# Altium project Carrier-Board-v1.0.PrjPcb (part 6 of 9)

## Sheet DIGITAL_I-O_O-P.SchDoc
size A4; SheetNumber: 14; SheetTotal: 20
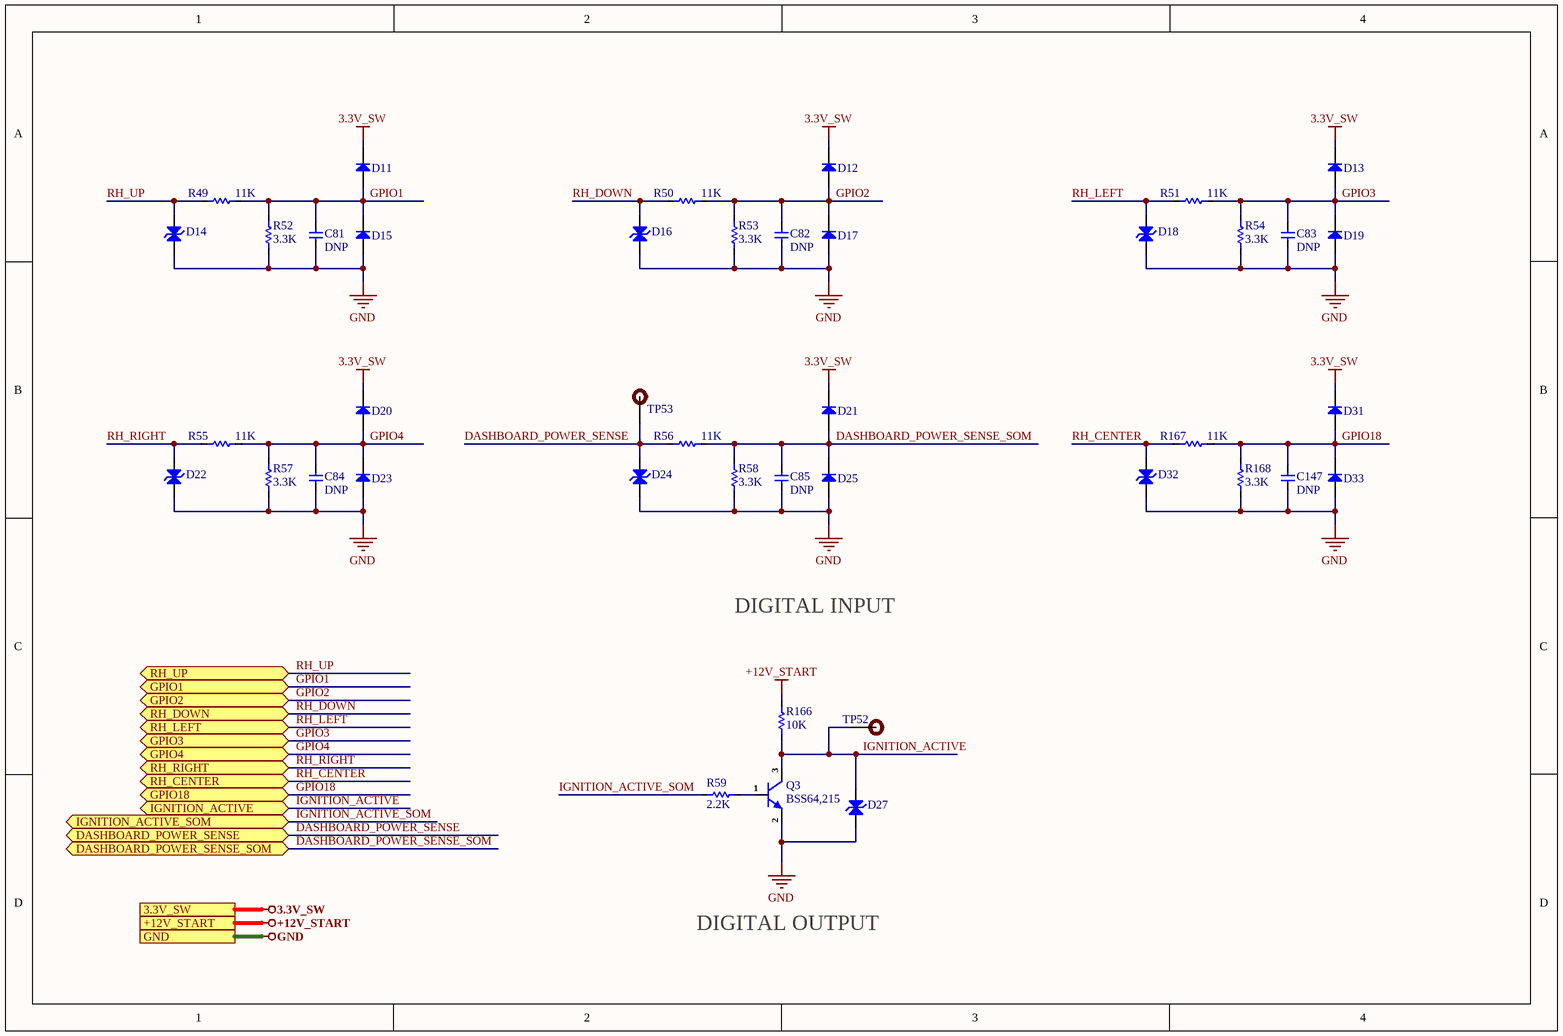
[diagram p13: DIGITAL_I-O_O-P.SchDoc]

### Parts
C81  DNP  [Cap-0603]
C82  DNP  [Cap-0603]
C83  DNP  [Cap-0603]
C84  DNP  [Cap-0603]
C85  DNP  [Cap-0603]
C147  DNP  [Cap-0603]
D11  BAS316,115  [SOD-323]  (value not drawn)
D12  BAS316,115  [SOD-323]  (value not drawn)
D13  BAS316,115  [SOD-323]  (value not drawn)
D14  SMAJ14CA-E3/61  [SMA]  (value not drawn)
D15  BAS316,115  [SOD-323]  (value not drawn)
D16  SMAJ14CA-E3/61  [SMA]  (value not drawn)
D17  BAS316,115  [SOD-323]  (value not drawn)
D18  SMAJ14CA-E3/61  [SMA]  (value not drawn)
D19  BAS316,115  [SOD-323]  (value not drawn)
D20  BAS316,115  [SOD-323]  (value not drawn)
D21  BAS316,115  [SOD-323]  (value not drawn)
D22  SMAJ14CA-E3/61  [SMA]  (value not drawn)
D23  BAS316,115  [SOD-323]  (value not drawn)
D24  SMAJ14CA-E3/61  [SMA]  (value not drawn)
D25  BAS316,115  [SOD-323]  (value not drawn)
D27  SMAJ14CA-E3/61  [SMA]  (value not drawn)
D31  BAS316,115  [SOD-323]  (value not drawn)
D32  SMAJ14CA-E3/61  [SMA]  (value not drawn)
D33  BAS316,115  [SOD-323]  (value not drawn)
Q3  BSS64,215  [SOT-23]
R49  11K  [Res-0603]
R50  11K  [Res-0603]
R51  11K  [Res-0603]
R52  3.3K  [Res-0603]
R53  3.3K  [Res-0603]
R54  3.3K  [Res-0603]
R55  11K  [Res-0603]
R56  11K  [Res-0603]
R57  3.3K  [Res-0603]
R58  3.3K  [Res-0603]
R59  2.2K  [Res-0603]
R166  10K  [Res-0603]
R167  11K  [Res-0603]
R168  3.3K  [Res-0603]
TP52  DNP  [Test-point]  (value not drawn)
TP53  DNP  [Test-point]  (value not drawn)

### Ports
3.3V_SW (see Top_Sheet[4B], ETHERNET_INTERFACE[1D], FUTURE_USE_CONNECTOR[1D], HDMI_INTERFACE[1D], I2C_INTERFACE[1B], MICRO_SD_CARD_INTERFACE[1D], UART_INTERFACE[1D]), +12V_START (see Top_Sheet[4A], CONNECTORS[1D], DC_DC_CONVERTER[1D], INPUT_SUPPLY_PROTECTION[1C]), DASHBOARD_POWER_SENSE (bidir, see Top_Sheet[3B], CONNECTORS[3D], GPIO_NC_INTERFACE[3D]), DASHBOARD_POWER_SENSE_SOM (bidir, see Top_Sheet[3B], GPIO_NC_INTERFACE[3D]), GND (see Top_Sheet[3A], 03-CAN2_SPI_CAN_CONTROLLER[1D], APALIS_POWER_SUPPLY[1D], CAN2_SPI_CAN_CONTROLLER[1D], CODEC_INTERFACE[1D], CONNECTORS[1D], DC_DC_CONVERTER[1D], ETHERNET_INTERFACE[1D], FUTURE_USE_CONNECTOR[1D], GPIO_NC_INTERFACE[4B], HDMI_INTERFACE[1D], I2C_INTERFACE[1B], INPUT_SUPPLY_PROTECTION[1D], LTE_MODULE[1D], MECHANICAL_FOR_PCB[1D], MICRO_SD_CARD_INTERFACE[1D], Reset_and_SDIO[1D], UART_INTERFACE[1D], USB3.0_INTERFACE[1D]), GPIO1 (bidir, see Top_Sheet[3B], FUTURE_USE_CONNECTOR[2C]), GPIO2 (bidir, see Top_Sheet[3B], FUTURE_USE_CONNECTOR[2C]), GPIO3 (bidir, see Top_Sheet[3B], FUTURE_USE_CONNECTOR[2C]), GPIO4 (bidir, see Top_Sheet[3B], FUTURE_USE_CONNECTOR[2C]), GPIO18 (bidir, see Top_Sheet[3B], GPIO_NC_INTERFACE[2A]), IGNITION_ACTIVE (bidir, see Top_Sheet[4B], CONNECTORS[4D]), IGNITION_ACTIVE_SOM (bidir, see Top_Sheet[4B], GPIO_NC_INTERFACE[1D]), RH_CENTER (bidir, see Top_Sheet[4B], CONNECTORS[4D]), RH_DOWN (bidir, see Top_Sheet[3B], CONNECTORS[4D]), RH_LEFT (bidir, see Top_Sheet[3B], CONNECTORS[4D]), RH_RIGHT (bidir, see Top_Sheet[3B], CONNECTORS[4D]), RH_UP (bidir, see Top_Sheet[3B], CONNECTORS[4D])

### Nets
3.3V_SW: D11.1(K) D12.1(K) D13.1(K) D20.1(K) D21.1(K) D31.1(K) ; port 3.3V_SW
+12V_START: R166.2 ; port +12V_START
GND: C81.1 C82.1 C83.1 C84.1 C85.1 C147.1 D14.1(A) D15.2(A) D16.1(A) D17.2(A) D18.1(A) D19.2(A) D22.1(A) D23.2(A) D24.1(A) D25.2(A) D27.1(A) D32.1(A) D33.2(A) Q3.2(E) R52.1 R53.1 R54.1 R57.1 R58.1 R168.1 ; port GND
DASHBOARD_POWER_SENSE: D24.2(A) R56.1 TP53.1 ; port DASHBOARD_POWER_SENSE
DASHBOARD_POWER_SENSE_SOM: C85.2 D21.2(A) D25.1(K) R56.2 R58.2 ; port DASHBOARD_POWER_SENSE_SOM
GPIO1: C81.2 D11.2(A) D15.1(K) R49.2 R52.2 ; port GPIO1
GPIO2: C82.2 D12.2(A) D17.1(K) R50.2 R53.2 ; port GPIO2
GPIO3: C83.2 D13.2(A) D19.1(K) R51.2 R54.2 ; port GPIO3
GPIO4: C84.2 D20.2(A) D23.1(K) R55.2 R57.2 ; port GPIO4
GPIO18: C147.2 D31.2(A) D33.1(K) R167.2 R168.2 ; port GPIO18
IGNITION_ACTIVE: D27.2(A) Q3.3(C) R166.1 TP52.1 ; port IGNITION_ACTIVE
IGNITION_ACTIVE_SOM: R59.1 ; port IGNITION_ACTIVE_SOM
RH_CENTER: D32.2(A) R167.1 ; port RH_CENTER
RH_DOWN: D16.2(A) R50.1 ; port RH_DOWN
RH_LEFT: D18.2(A) R51.1 ; port RH_LEFT
RH_RIGHT: D22.2(A) R55.1 ; port RH_RIGHT
RH_UP: D14.2(A) R49.1 ; port RH_UP
NetQ3_1: Q3.1(B) R59.2

### Notes on the sheet
- DIGITAL INPUT
- DIGITAL OUTPUT

### Library data of the parts
C81-C85 C147 = C1608NP01H101J080AA: as C78 on sheet I2C_INTERFACE; Supplier: Arrow Electronics; Supplier Part Number: C1608NP01H101J080AA; Manufacturer Part Number: C1608NP01H101J080AA; RoHS: Yes; Category: Ceramic Capacitors; Stock: 1236; Pricing: 1=0.1172, 10=0.0734, 25=0.0727, 50=0.0628, 100=0.0474, 250=0.0469, 500=0.0388, 1000=0.0313 (USD); ComponentLink1URL: http://www.mouser.com/ds/2/400/tdk_mlcc_commercial_general_en-542463.pdf?src-supplier=Mouser; ComponentLink1Description: http://www.mouser.com/ds/2/400/tdk_mlcc_commercial_general_en-542463.pdf?src-supplier=Mouser; ComponentLink2URL: https://datasheet.octopart.com/C1608NP01H101J080AA-TDK-datasheet-43914282.pdf?src-supplier=Future+Electronics; ComponentLink2Description: https://datasheet.octopart.com/C1608NP01H101J080AA-TDK-datasheet-43914282.pdf?src-supplier=Future+Electronics; ComponentLink3URL: https://product.tdk.com/info/en/catalog/datasheets/mlcc_commercial_hightemp_en.pdf?ref_disty=digikey&src-supplier=Digi-Key; ComponentLink3Description: https://product.tdk.com/info/en/catalog/datasheets/mlcc_commercial_hightemp_en.pdf?ref_disty=digikey&src-supplier=Digi-Key; ComponentLink4URL: https://product.tdk.com/info/en/documents/chara_sheet/C1608NP01H101J080AA.pdf?src-supplier=Digi-Key; ComponentLink4Description: https://product.tdk.com/info/en/documents/chara_sheet/C1608NP01H101J080AA.pdf?src-supplier=Digi-Key; ComponentLink5URL: http://product.tdk.com/en/catalog/datasheets/mlcc_commercial_hightemp_en.pdf?src-supplier=Avnet; ComponentLink5Description: http://product.tdk.com/en/catalog/datasheets/mlcc_commercial_hightemp_en.pdf?src-supplier=Avnet
D11-D13 D15 D17 D19-D21 D23 D25 D31 D33 = BAS316,115: as D5 on sheet I2C_INTERFACE; Supplier: Rs; Supplier Part Number: 1821844P; Manufacturer Part Number: BAS316,115; RoHS: Yes; Category: Rectifier Diodes; Stock: 258600; Pricing: 600=0.062, 1200=0.039, 1800=0.037, 2400=0.035 (GBP); Pins: 2NUMBER; Max Operating Temperature: 150°C; Max Repetitive Reverse Voltage (Vrrm): 100V; Packaging: 10Packaging; Reverse Voltage: 100V; Height: 1.1mm; RoHS Compliant: Yes; ComponentLink1URL: http://www.farnell.com/datasheets/1856332.pdf?src-supplier=Farnell; ComponentLink1Description: http://www.farnell.com/datasheets/1856332.pdf?src-supplier=Farnell; ComponentLink2URL: https://assets.nexperia.com/documents/data-sheet/BAS16_SER.pdf?src-supplier=Digi-Key; ComponentLink2Description: https://assets.nexperia.com/documents/data-sheet/BAS16_SER.pdf?src-supplier=Digi-Key; ComponentLink3URL: https://datasheet.octopart.com/BAS316%2C115-Nexperia-datasheet-77871323.pdf?src-supplier=Future+Electronics; ComponentLink3Description: https://datasheet.octopart.com/BAS316%2C115-Nexperia-datasheet-77871323.pdf?src-supplier=Future+Electronics; ComponentLink4URL: https://datasheet.octopart.com/BAS316%2C115-Nexperia-datasheet-32749520.pdf?src-supplier=Element14; ComponentLink4Description: https://datasheet.octopart.com/BAS316%2C115-Nexperia-datasheet-32749520.pdf?src-supplier=Element14; ComponentLink5URL: http://www.farnell.com/datasheets/1856332.pdf?src-supplier=Newark; ComponentLink5Description: http://www.farnell.com/datasheets/1856332.pdf?src-supplier=Newark; ComponentLink6URL: https://datasheet.octopart.com/BAS316%2C115-NXP-datasheet-5319124.pdf?src-supplier=TME; ComponentLink6Description: https://datasheet.octopart.com/BAS316%2C115-NXP-datasheet-5319124.pdf?src-supplier=TME
D14 D16 D18 D22 D24 D27 D32 = SMAJ14CA-E3/61: as D7 on sheet I2C_INTERFACE; Supplier: Mouser; Supplier Part Number: 625-SMAJ14CA-E3; Manufacturer Part Number: SMAJ14CA-E3/61; RoHS: Yes; Category: TVS Diodes; Stock: 15510; Pricing: 1=0.48, 10=0.36, 50=0.36, 100=0.221, 1000=0.127, 10000=0.099 (USD); ComponentLink1URL: https://datasheet.ciiva.com/4515/smaj50a-241759-4515304.pdf?src-supplier=Mouser; ComponentLink1Description: https://datasheet.ciiva.com/4515/smaj50a-241759-4515304.pdf?src-supplier=Mouser; ComponentLink2URL: https://datasheet.ciiva.com/16382/smaj50a-16382075.pdf?src-supplier=Future+Electronics; ComponentLink2Description: https://datasheet.ciiva.com/16382/smaj50a-16382075.pdf?src-supplier=Future+Electronics
Q3 = BSS64,215: TRANS NPN 80V 0.1A TO236AB; Manufacturer: Nexperia; Supplier: Future Electronics; Supplier Part Number: 6621338; Manufacturer Part Number: BSS64,215; RoHS: Yes; Category: BJTs; Stock: 3000; Pricing: 3000=0.0487, 9000=0.047, 15000=0.0462, 60000=0.044, 90000=0.0427 (USD); Packaging: 10Packaging; ComponentLink1URL: https://datasheet.octopart.com/BSS64%2C215-Nexperia-datasheet-87581098.pdf?src-supplier=TME; ComponentLink1Description: https://datasheet.octopart.com/BSS64%2C215-Nexperia-datasheet-87581098.pdf?src-supplier=TME
R49-R51 R55 R56 R167 = RT0603DRD0711KL: as R45 on sheet I2C_INTERFACE; Supplier: Future Electronics; Supplier Part Number: 3061514; Manufacturer Part Number: RT0603DRD0711KL; RoHS: Yes; Category: Chip SMD Resistors; Stock: 70000; Pricing: 5000=0.0133, 15000=0.0128, 25000=0.0126, 100000=0.012, 150000=0.0117 (USD); ComponentLink1URL: https://datasheet.ciiva.com/8891/pyu-rt-1-to-0-05-rohs-l-4-8891301.pdf?src-supplier=Avnet; ComponentLink1Description: https://datasheet.ciiva.com/8891/pyu-rt-1-to-0-05-rohs-l-4-8891301.pdf?src-supplier=Avnet
R52-R54 R57 R58 R168 = ERJ-U3RD3301V: as R47 on sheet I2C_INTERFACE; Supplier: Mouser; Supplier Part Number: 667-ERJ-U3RD3301V; Manufacturer Part Number: ERJ-U3RD3301V; RoHS: No; Category: Chip SMD Resistors; Stock: 19153; Pricing: 1=0.19, 10=0.105, 50=0.105, 100=0.047, 1000=0.029, 10000=0.023 (USD)
R59 = ERA-3AED222V: RES SMD 2.2K OHM 0.5% 1/10W 0603; Manufacturer: Panasonic; Value: 2.2kR; Power Rating: 100mW; Voltage Rating: 150V; Temperature Coefficient: 25ppm/°C; Supplier: Digi-Key; Supplier Part Number: P123753DKR-ND; Manufacturer Part Number: ERA-3AED222V; RoHS: Yes; Category: Chip SMD Resistors; Pricing: 1=0.27, 10=0.23, 25=0.1672, 50=0.1212, 100=0.0899, 250=0.069, 500=0.05436, 1000=0.03763 (USD); Mounting Technology: Surface Mount; Case/Package: 0603; Case Code (Imperial): 0603; Case Code (Metric): 1608; Contact Plating: Tin; Min Operating Temperature: -55°C; Max Operating Temperature: 155°C; Tolerance: 0.5%; Package Quantity: 5000; Packaging: Tape and Reel; Series: ERA-3A; Features: Automotive AEC-Q200; Max Power Dissipation: 100mW; Number of Terminations: 2; Length: 1.6mm; Width: 0.8mm; Height: 0.45mm; Ratings: AEC-Q200; Lead Free: Lead Free; RoHS Compliant: Yes; ComponentLink1URL: https://datasheet.ciiva.com/24024/aoa0000ce26-197354-24024457.pdf?src-supplier=Mouser; ComponentLink1Description: https://datasheet.ciiva.com/24024/aoa0000ce26-197354-24024457.pdf?src-supplier=Mouser
R166 = RCA060310K0FKEAHP: RES SMD 10K OHM 1% 1/10W 0603; Manufacturer: Vishay Dale; Value: 10kR; Max Power Dissipation: 250mW; Temperature Coefficient: 100ppm/°C; Supplier: Future Electronics; Supplier Part Number: 4171415; Manufacturer Part Number: RCA060310K0FKEAHP; RoHS: Yes; Category: Chip SMD Resistors; Stock: 10000; Pricing: 5000=0.0413, 10000=0.0403, 15000=0.0397, 25000=0.0389, 50000=0.0374 (USD); Case/Package: 0603; Case Code (Imperial): 0603; Case Code (Metric): 1608; Min Operating Temperature: -55°C; Max Operating Temperature: 155°C; Features: Automotive AEC-Q200,Anti-Sulfur; Packaging: Cut Tape; Tolerance: 1%; Number of Terminations: 2; Series: RCA-HP; Ratings: AEC-Q200; RoHS Compliant: Yes; ComponentLink1URL: http://www.vishay.com/docs/20067/rcahp.pdf?src-supplier=Digi-Key; ComponentLink1Description: http://www.vishay.com/docs/20067/rcahp.pdf?src-supplier=Digi-Key
TP52 TP53 = TEST POINT: Test Point ON; Item Type: TEST POINT

## Sheet CONNECTORS.SchDoc
size A4; SheetNumber: 15; SheetTotal: 20
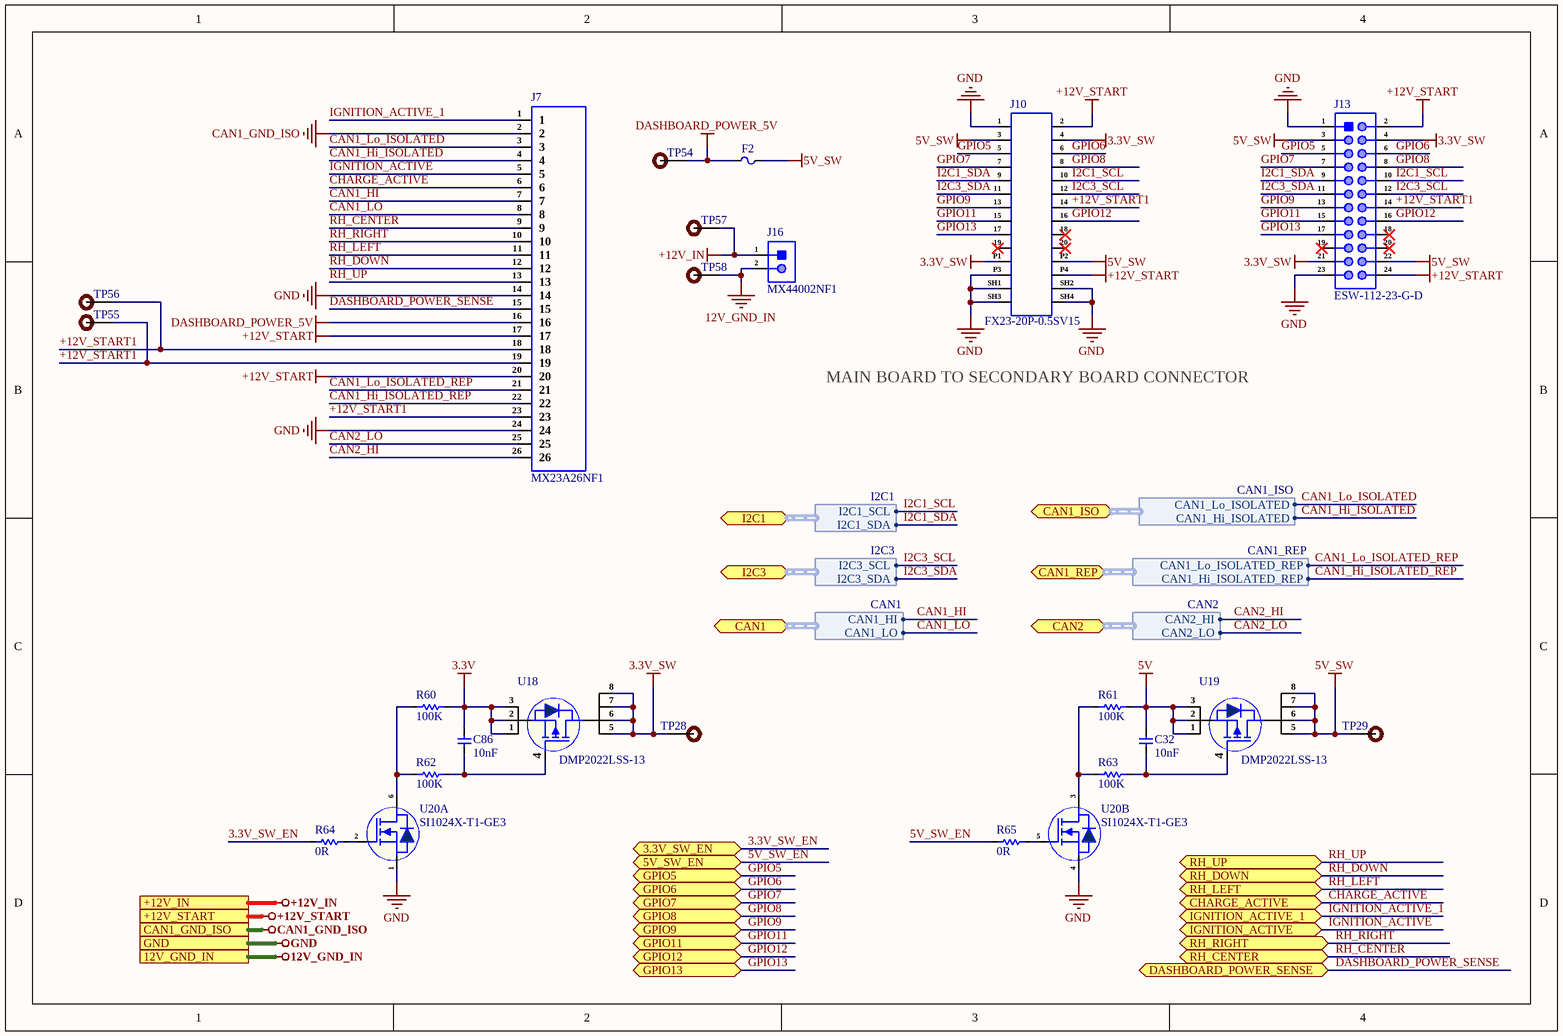
[diagram p14: CONNECTORS.SchDoc]

### Parts
C32  10nF  [Cap-0402]
C86  10nF  [Cap-0402]
F2  0458001.DR  [0458001.DR]  (value not drawn)
J7  MX23A26NF1  [MX23A26NF1]
J10  FX23-20P-0.5SV15  [FX23-20P-0.5SV15]
J13  ESW-112-23-G-D  [ESW-112-23-G-D]
J16  MX44002NF1  [MX44002NF1]
R60  100K  [Res-0402]
R61  100K  [Res-0402]
R62  100K  [Res-0402]
R63  100K  [Res-0402]
R64  0R  [Res-0402]
R65  0R  [Res-0402]
TP28  DNP  [Test-point]  (value not drawn)
TP29  DNP  [Test-point]  (value not drawn)
TP54  DNP  [Test-point]  (value not drawn)
TP55  DNP  [Test-point]  (value not drawn)
TP56  DNP  [Test-point]  (value not drawn)
TP57  DNP  [Test-point]  (value not drawn)
TP58  DNP  [Test-point]  (value not drawn)
U18  DMP2022LSS-13  [SOIC-8]
U19  DMP2022LSS-13  [SOIC-8]
U20  SI1024X-T1-GE3  [SC-89]  (parts A,B of 2)

### Ports
3.3V_SW_EN (bidir, see Top_Sheet[3D], I2C_INTERFACE[2B]), 5V_SW_EN (bidir, see Top_Sheet[3D], I2C_INTERFACE[2B]), 12V_GND_IN (see Top_Sheet[3C], INPUT_SUPPLY_PROTECTION[1D]), +12V_IN (see Top_Sheet[4C], INPUT_SUPPLY_PROTECTION[1C]), +12V_START (see Top_Sheet[4C], DC_DC_CONVERTER[1D], DIGITAL_I-O_O-P[1D], INPUT_SUPPLY_PROTECTION[1C]), CAN1 (bidir, harness CAN1, see Top_Sheet[4C], 03-CAN2_SPI_CAN_CONTROLLER[3D]), CAN1_GND_ISO (see Top_Sheet[3C], 03-CAN2_SPI_CAN_CONTROLLER[1D]), CAN1_ISO (bidir, harness CAN1_ISO, see Top_Sheet[4C], 03-CAN2_SPI_CAN_CONTROLLER[3C]), CAN1_REP (bidir, harness CAN1_REP, see Top_Sheet[4C], 03-CAN2_SPI_CAN_CONTROLLER[3D]), CAN2 (bidir, harness CAN2, see Top_Sheet[4D], CAN2_SPI_CAN_CONTROLLER[2D]), CHARGE_ACTIVE (bidir, see Top_Sheet[3D], I2C_INTERFACE[2B]), DASHBOARD_POWER_SENSE (bidir, see Top_Sheet[3D], DIGITAL_I-O_O-P[1D], GPIO_NC_INTERFACE[3D]), GND (see Top_Sheet[3C], 03-CAN2_SPI_CAN_CONTROLLER[1D], APALIS_POWER_SUPPLY[1D], CAN2_SPI_CAN_CONTROLLER[1D], CODEC_INTERFACE[1D], DC_DC_CONVERTER[1D], DIGITAL_I-O_O-P[1D], ETHERNET_INTERFACE[1D], FUTURE_USE_CONNECTOR[1D], GPIO_NC_INTERFACE[4B], HDMI_INTERFACE[1D], I2C_INTERFACE[1B], INPUT_SUPPLY_PROTECTION[1D], LTE_MODULE[1D], MECHANICAL_FOR_PCB[1D], MICRO_SD_CARD_INTERFACE[1D], Reset_and_SDIO[1D], UART_INTERFACE[1D], USB3.0_INTERFACE[1D]), GPIO5 (bidir, see Top_Sheet[3C], FUTURE_USE_CONNECTOR[2C]), GPIO6 (bidir, see Top_Sheet[3C], FUTURE_USE_CONNECTOR[2C]), GPIO7 (bidir, see Top_Sheet[3C], FUTURE_USE_CONNECTOR[2C]), GPIO8 (bidir, see Top_Sheet[3C], FUTURE_USE_CONNECTOR[2D]), GPIO9 (bidir, see Top_Sheet[3C], FUTURE_USE_CONNECTOR[3C], GPIO_NC_INTERFACE[1D]), GPIO11 (bidir, see Top_Sheet[3C], FUTURE_USE_CONNECTOR[3C], GPIO_NC_INTERFACE[3B]), GPIO12 (bidir, see Top_Sheet[3C], FUTURE_USE_CONNECTOR[3C], GPIO_NC_INTERFACE[3B]), GPIO13 (bidir, see Top_Sheet[3C], FUTURE_USE_CONNECTOR[3C], GPIO_NC_INTERFACE[3B]), I2C1 (bidir, harness I2C1, see Top_Sheet[3D], FUTURE_USE_CONNECTOR[2D], I2C_INTERFACE[4B]), I2C3 (bidir, harness I2C3, see Top_Sheet[3C], CODEC_INTERFACE[3D], I2C_INTERFACE[4B]), IGNITION_ACTIVE (bidir, see Top_Sheet[4D], DIGITAL_I-O_O-P[1D]), IGNITION_ACTIVE_1 (bidir, see Top_Sheet[3D], I2C_INTERFACE[2B]), RH_CENTER (bidir, see Top_Sheet[4C], DIGITAL_I-O_O-P[1D]), RH_DOWN (bidir, see Top_Sheet[4C], DIGITAL_I-O_O-P[1C]), RH_LEFT (bidir, see Top_Sheet[4C], DIGITAL_I-O_O-P[1C]), RH_RIGHT (bidir, see Top_Sheet[4C], DIGITAL_I-O_O-P[1C]), RH_UP (bidir, see Top_Sheet[4C], DIGITAL_I-O_O-P[1C])

### Harnesses
CAN1_ISO: CAN1_Lo_ISOLATED, CAN1_Hi_ISOLATED
CAN1_REP: CAN1_Lo_ISOLATED_REP, CAN1_Hi_ISOLATED_REP
CAN1: CAN1_HI, CAN1_LO
I2C1: I2C1_SCL, I2C1_SDA
I2C3: I2C3_SCL, I2C3_SDA
CAN2: CAN2_HI, CAN2_LO

### Nets
3.3V: C86.2 R60.2 U18.1(S) U18.2(S) U18.3(S)
3.3V_SW: J10.4 J10.P1 J13.4 J13.21 TP28.1 U18.5(D) U18.6(D) U18.7(D) U18.8(D)
5V: C32.2 R61.2 U19.1(S) U19.2(S) U19.3(S)
5V_SW: F2.2 J10.3 J10.P2 J13.3 J13.22 TP29.1 U19.5(D) U19.6(D) U19.7(D) U19.8(D)
12V_GND_IN: J16.2 TP58.1 ; port 12V_GND_IN
+12V_IN: J16.1 TP57.1 ; port +12V_IN
+12V_START: J7.17 J7.20 J10.2 J10.P4 J13.2 J13.24 ; port +12V_START
CAN1_GND_ISO: J7.2 ; port CAN1_GND_ISO
DASHBOARD_POWER_5V: F2.1 J7.16 TP54.1
GND: J7.14 J7.24 J10.1 J10.P3 J10.SH1 J10.SH2 J10.SH3 J10.SH4 J13.1 J13.23 U20.1(S1) U20.4(S2) ; port GND
3.3V_SW_EN: R64.1 ; port 3.3V_SW_EN
5V_SW_EN: R65.1 ; port 5V_SW_EN
+12V_START1: J7.18 J7.19 J7.23 J10.14 J13.14 TP55.1 TP56.1
CAN1_HI: J7.7 ; port CAN1.CAN1_HI  [project net CAN1.CAN1_HI]
CAN1_Hi_ISOLATED: J7.4 ; port CAN1_ISO.CAN1_Hi_ISOLATED
CAN1_Hi_ISOLATED_REP: J7.22 ; port CAN1_REP.CAN1_Hi_ISOLATED_REP
CAN1_LO: J7.8 ; port CAN1.CAN1_LO  [project net CAN1.CAN1_LO]
CAN1_Lo_ISOLATED: J7.3 ; port CAN1_ISO.CAN1_Lo_ISOLATED  [project net CAN1_ISO.CAN1_Lo_ISOLATED]
CAN1_Lo_ISOLATED_REP: J7.21 ; port CAN1_REP.CAN1_Lo_ISOLATED_REP
CAN2_HI: J7.26 ; port CAN2.CAN2_HI  [project net CAN2.CAN2_HI]
CAN2_LO: J7.25 ; port CAN2.CAN2_LO  [project net CAN2.CAN2_LO]
CHARGE_ACTIVE: J7.6 ; port CHARGE_ACTIVE
DASHBOARD_POWER_SENSE: J7.15 ; port DASHBOARD_POWER_SENSE
GPIO5: J10.5 J13.5 ; port GPIO5
GPIO6: J10.6 J13.6 ; port GPIO6
GPIO7: J10.7 J13.7 ; port GPIO7
GPIO8: J10.8 J13.8 ; port GPIO8
GPIO9: J10.13 J13.13 ; port GPIO9
GPIO11: J10.15 J13.15 ; port GPIO11
GPIO12: J10.16 J13.16 ; port GPIO12
GPIO13: J10.17 J13.17 ; port GPIO13
I2C1_SCL: J10.10 J13.10 ; port I2C1.I2C1_SCL  [project net I2C1.I2C1_SCL]
I2C1_SDA: J10.9 J13.9 ; port I2C1.I2C1_SDA  [project net I2C1.I2C1_SDA]
I2C3_SCL: J10.12 J13.12 ; port I2C3.I2C3_SCL  [project net I2C3.I2C3_SCL]
I2C3_SDA: J10.11 J13.11 ; port I2C3.I2C3_SDA  [project net I2C3.I2C3_SDA]
IGNITION_ACTIVE: J7.5 ; port IGNITION_ACTIVE
IGNITION_ACTIVE_1: J7.1 ; port IGNITION_ACTIVE_1
RH_CENTER: J7.9 ; port RH_CENTER
RH_DOWN: J7.12 ; port RH_DOWN
RH_LEFT: J7.11 ; port RH_LEFT
RH_RIGHT: J7.10 ; port RH_RIGHT
RH_UP: J7.13 ; port RH_UP
NetC32_1: C32.1 R63.2 U19.4(G)
NetC86_1: C86.1 R62.2 U18.4(G)
NetR60_1: R60.1 R62.1 U20.6(D1)
NetR61_1: R61.1 R63.1 U20.3(D2)
NetR64_2: R64.2 U20.2(G1)
NetR65_2: R65.2 U20.5(G2)

Not connected (* = marked no-connect by the designer): J10 18* 19* 20*; J13 18* 19* 20*

### Notes on the sheet
- MAIN BOARD TO SECONDARY BOARD CONNECTOR

### Library data of the parts
C32 C86 = C0402C103K5RAC7411: CAP CER 10000PF 50V X7R 0402; Manufacturer: KEMET; Dielectric Material: Ceramic; Tolerance: 10%; Item Type: Capacitor; Supplier: Mouser; Supplier Part Number: 80-C0402C103K5R7411; Manufacturer Part Number: C0402C103K5RAC7411; RoHS: Yes; Category: Ceramic Capacitors; Stock: 440672; Pricing: 1=0.1, 10=0.017, 50=0.017, 100=0.009, 1000=0.005, 10000=0.004 (USD); Mounting Technology: Surface Mount; Case/Package: 0402; Min Operating Temperature: -55°C; Max Operating Temperature: 125°C; Value: 10nF; Dielectric: X7R; Voltage Rating (DC): 50V; Construction: Flat; Length: 1mm; Height: 0.5mm; Depth: 0.5mm; Radiation Hardening: No; RoHS Compliant: Yes; ComponentLink1URL: http://capacitoredge.kemet.com/capedge2/DataSheet?pn=C0402C103K5RAC7411&src-supplier=Avnet; ComponentLink1Description: http://capacitoredge.kemet.com/capedge2/DataSheet?pn=C0402C103K5RAC7411&src-supplier=Avnet
F2 = 0458001.DR: FUSE BRD MNT 1A 48VAC 75VDC 1206; Manufacturer: Littelfuse; Supplier: Rs; Supplier Part Number: 1740295; Manufacturer Part Number: 0458001.DR; RoHS: Yes; Category: Fuses; Stock: 140; Pricing: 1=0.76003, 10=0.73892, 25=0.71895, 50=0.70003 (GBP); ComponentLink1URL: https://datasheet.ciiva.com/299/littelfuse-fuse-458-series-299789.pdf?src-supplier=Digi-Key; ComponentLink1Description: https://datasheet.ciiva.com/299/littelfuse-fuse-458-series-299789.pdf?src-supplier=Digi-Key; ComponentLink2URL: https://datasheet.ciiva.com/299/littelfuse-fuse-458-series-299790.pdf?src-supplier=Digi-Key; ComponentLink2Description: https://datasheet.ciiva.com/299/littelfuse-fuse-458-series-299790.pdf?src-supplier=Digi-Key; ComponentLink3URL: https://datasheet.ciiva.com/299/littelfuse-fuse-458-series-299791.pdf?src-supplier=Digi-Key; ComponentLink3Description: https://datasheet.ciiva.com/299/littelfuse-fuse-458-series-299791.pdf?src-supplier=Digi-Key; ComponentLink4URL: https://datasheet.ciiva.com/1730/337915-1730543.pdf?src-supplier=Newark; ComponentLink4Description: https://datasheet.ciiva.com/1730/337915-1730543.pdf?src-supplier=Newark; ComponentLink5URL: https://datasheet.ciiva.com/7991/337915-7991902.pdf?src-supplier=Element14; ComponentLink5Description: https://datasheet.ciiva.com/7991/337915-7991902.pdf?src-supplier=Element14; ComponentLink6URL: https://datasheet.ciiva.com/1549/337915-1549634.pdf?src-supplier=Element14; ComponentLink6Description: https://datasheet.ciiva.com/1549/337915-1549634.pdf?src-supplier=Element14; Item Type: Fuse
J7 = MX23A26NF1: CONN HEADER R/A 26POS 2.5MM; Manufacturer: JAE Electronics; Current Rating: 3A; Gender: Male; Connector Type: Header,Power,Rectangular; Number of Positions: 26; Insulation Resistance: 100MR; Wire Gauge (Max): 16AWG; Wire Gauge (Min): 22AWG; Outside Diameter: 2.2mm; Ratings: Waterproof; Supplier: Rs; Supplier Part Number: 435774; Manufacturer Part Number: MX23A26NF1; RoHS: Yes; Category: Automotive Connectors; Stock: 42; Pricing: 1=7.15, 10=6.83, 20=6.5 (GBP); Mounting Technology: Through Hole; Contact Material: Copper Alloy,Brass,Copper; Contact Plating: Tin; Color: Black; Material: PBT,Polybutylene; Contact Shape: Square; Contact Finish - Mating: TIN; Insulation Material: PBT; Insulation Color: Black; Min Operating Temperature: -40°C; Max Operating Temperature: 125°C; Number of Rows: 2; Packaging: Bulk; Package Quantity: 160; Termination: Solder; Number of Contacts: 26; Orientation: Right Angle; Features: WATERPROOF; Series: MX23A; Contact Type: Male Pin; Fastening Type: Latch; Length: 44mm; Pitch: 2.5mm; Reach SVHC Compliant: No; RoHS Compliant: Yes; ComponentLink1URL: https://datasheet.ciiva.com/11748/0900766b80fc1621-11748856.pdf?src-supplier=Rs; ComponentLink1Description: https://datasheet.ciiva.com/11748/0900766b80fc1621-11748856.pdf?src-supplier=Rs; ComponentLink2URL: https://datasheet.ciiva.com/7621/611555-7621573.pdf?src-supplier=Element14; ComponentLink2Description: https://datasheet.ciiva.com/7621/611555-7621573.pdf?src-supplier=Element14; ComponentLink3URL: https://datasheet.ciiva.com/726/transportation-pg-v2-2-726957.pdf?src-supplier=Digi-Key; ComponentLink3Description: https://datasheet.ciiva.com/726/transportation-pg-v2-2-726957.pdf?src-supplier=Digi-Key
J10 = FX23-20P-0.5SV15: CONN HDR 20POS SMD GOLD; Manufacturer: Hirose; Supplier: Future Electronics; Supplier Part Number: 4093766; Manufacturer Part Number: FX23-20P-0.5SV15; RoHS: Yes; Category: Board to Board Connectors; Stock: 1092; Pricing: 84=2.41, 168=2.36, 252=2.34, 420=2.31, 840=2.25 (USD); ComponentLink1URL: https://www.hirose.com/product/en/download_file/key_name/FX23-20P-0.5SV15/category/Specification%20Sheet/doc_file_id/88145/?file_category_id=9&item_id=05733001000&is_series=&src-supplier=Digi-Key; ComponentLink1Description: https://www.hirose.com/product/en/download_file/key_name/FX23-20P-0.5SV15/category/Specification%20Sheet/doc_file_id/88145/?file_category_id=9&item_id=05733001000&is_series=&src-supplier=Digi-Key; ComponentLink2URL: https://datasheet.octopart.com/FX23-20P-0.5SV15-Hirose-datasheet-155938459.pdf?src-supplier=Sager+Electronics; ComponentLink2Description: https://datasheet.octopart.com/FX23-20P-0.5SV15-Hirose-datasheet-155938459.pdf?src-supplier=Sager+Electronics
J13 = ESW-112-23-G-D: CONN SOCKET 24POS 0.1 GOLD PCB; Manufacturer: Samtec; Supplier: Digi-Key; Supplier Part Number: ESW-112-23-G-D-ND; Manufacturer Part Number: ESW-112-23-G-D; RoHS: Yes; Category: Connectors; Stock: 108; Pricing: 1=7.81, 10=7.057, 100=6.1792, 500=5.20352, 1000=4.55308 (USD); ComponentLink1URL: https://datasheet.ciiva.com/15195/getdatasheetpartid-567182-15195174.pdf?src-supplier=Verical; ComponentLink1Description: https://datasheet.ciiva.com/15195/getdatasheetpartid-567182-15195174.pdf?src-supplier=Verical
J16 = MX44002NF1: CONN HEADER BRD EDGE 2POS 3.5MM; Manufacturer: JAE Electronics; Supplier: Mouser; Supplier Part Number: 656-MX44002NF1; Manufacturer Part Number: MX44002NF1; RoHS: Yes; Category: Automotive Connectors; Stock: 525; Pricing: 1=5.41, 10=4.37, 50=4.37, 100=4.33, 1000=3.14, 10000=2.92 (USD); ComponentLink1URL: https://datasheet.ciiva.com/13878/sj107054-48235-13878974.pdf?src-supplier=Mouser; ComponentLink1Description: https://datasheet.ciiva.com/13878/sj107054-48235-13878974.pdf?src-supplier=Mouser; ComponentLink2URL: https://datasheet.ciiva.com/11754/0900766b80fb029b-11754147.pdf?src-supplier=Rs; ComponentLink2Description: https://datasheet.ciiva.com/11754/0900766b80fb029b-11754147.pdf?src-supplier=Rs; ComponentLink3URL: https://datasheet.ciiva.com/7621/1448958-7621599.pdf?src-supplier=Element14; ComponentLink3Description: https://datasheet.ciiva.com/7621/1448958-7621599.pdf?src-supplier=Element14; ComponentLink4URL: https://datasheet.ciiva.com/733/transportation-pg-v2-2-733517.pdf?src-supplier=Digi-Key; ComponentLink4Description: https://datasheet.ciiva.com/733/transportation-pg-v2-2-733517.pdf?src-supplier=Digi-Key; ComponentLink5URL: https://datasheet.ciiva.com/29364/l0132s0193blm18p-29364421.pdf?src-supplier=Digi-Key; ComponentLink5Description: https://datasheet.ciiva.com/29364/l0132s0193blm18p-29364421.pdf?src-supplier=Digi-Key; ComponentLink6URL: https://datasheet.ciiva.com/29364/l0132s0193blm18p-29364423.pdf?src-supplier=Digi-Key; ComponentLink6Description: https://datasheet.ciiva.com/29364/l0132s0193blm18p-29364423.pdf?src-supplier=Digi-Key; ComponentLink7URL: https://datasheet.ciiva.com/29364/l0132s0193blm18p-29364425.pdf?src-supplier=Digi-Key; ComponentLink7Description: https://datasheet.ciiva.com/29364/l0132s0193blm18p-29364425.pdf?src-supplier=Digi-Key
R60-R63 = RC0402JR-07100KL: as R33 on sheet Reset_and_SDIO; Supplier: Future Electronics; Supplier Part Number: 4246625; Manufacturer Part Number: RC0402JR-07100KL; RoHS: Yes; Category: Chip SMD Resistors; Stock: 7540000; Pricing: 10000=0.0013, 100000=0.0008, 200000=0.0013, 400000=0.0008, 750000=0.0012, 1250000=0.0007, 2500000=0.0012, 4000000=0.0007, 10000000=0.0011 (USD); Case/Package: 0402; Case Code (Metric): 1005; Case Code (Imperial): 0402; Min Operating Temperature: -55°C; Max Operating Temperature: 155°C; Packaging: Tape and Reel; Termination: SMD/SMT; Tolerance: 5%; Series: RC; Resistor Type: Thick Film; Number of Terminations: 2; Features: Moisture Resistant; Resistance Tolerance: 5%; Construction: Rectangular; Length: 1mm; Depth: 0.5mm; Lead Free: Lead Free; Reach SVHC Compliant: Unknown; RoHS Compliant: Yes; Military Standard: Not; ComponentLink1URL: https://datasheet.ciiva.com/2491/pyu-r-int-thick-7-2491208.pdf?src-supplier=Digi-Key; ComponentLink1Description: https://datasheet.ciiva.com/2491/pyu-r-int-thick-7-2491208.pdf?src-supplier=Digi-Key; ComponentLink2URL: https://datasheet.ciiva.com/46394/1018594-46394941.pdf?src-supplier=Element14; ComponentLink2Description: https://datasheet.ciiva.com/46394/1018594-46394941.pdf?src-supplier=Element14; ComponentLink3URL: https://datasheet.ciiva.com/2491/pyu-r-int-thick-7-2491209.pdf?src-supplier=Digi-Key; ComponentLink3Description: https://datasheet.ciiva.com/2491/pyu-r-int-thick-7-2491209.pdf?src-supplier=Digi-Key; ComponentLink4URL: https://datasheet.ciiva.com/2491/pyu-r-int-thick-7-2491207.pdf?src-supplier=Digi-Key; ComponentLink4Description: https://datasheet.ciiva.com/2491/pyu-r-int-thick-7-2491207.pdf?src-supplier=Digi-Key; ComponentLink5URL: https://datasheet.ciiva.com/12668/pyu-rc0402-51-rohs-l-6-r-12668218.pdf?src-supplier=Mouser; ComponentLink5Description: https://datasheet.ciiva.com/12668/pyu-rc0402-51-rohs-l-6-r-12668218.pdf?src-supplier=Mouser
R64 R65 = ERJ-2GE0R00X: as R149-R152 on sheet Reset_and_SDIO; Supplier: Mouser; Supplier Part Number: 667-ERJ-2GE0R00X; Manufacturer Part Number: ERJ-2GE0R00X; RoHS: Yes; Category: Chip SMD Resistors; Stock: 10959876; Pricing: 1=0.1, 10=0.013, 50=0.013, 100=0.006, 1000=0.004, 10000=0.003 (USD); Mounting Technology: Surface Mount; Case/Package: 0402; Pins: 2NUMBER; Contact Plating: Tin; Case Code (Metric): 1005; Case Code (Imperial): 0402; Min Operating Temperature: -55°C; Max Operating Temperature: 155°C; Resistor Type: Thick Film; Packaging: Cut Tape; Package Quantity: 10000; Number of Terminations: 2; Termination: SMD/SMT; Max Power Dissipation: 100mW; Voltage Rating (DC): 50V; Features: Automotive AEC-Q200; Series: ERJ; Construction: Rectangular; Technology: THICK FILM; Length: 1mm; Width: 0.5mm; Height: 0.35mm; Depth: 0.5mm; Ratings: AEC-Q200; Radiation Hardening: No; Reach SVHC Compliant: No; Military Standard: Not; Lead Free: Lead Free; RoHS Compliant: Yes; ComponentLink1URL: https://datasheet.ciiva.com/11821/0900766b80f806dd-11821176.pdf?src-supplier=Rs; ComponentLink1Description: https://datasheet.ciiva.com/11821/0900766b80f806dd-11821176.pdf?src-supplier=Rs; ComponentLink2URL: https://datasheet.ciiva.com/46389/1678796-46389518.pdf?src-supplier=Element14; ComponentLink2Description: https://datasheet.ciiva.com/46389/1678796-46389518.pdf?src-supplier=Element14; ComponentLink3URL: https://datasheet.ciiva.com/28695/1678796-28695758.pdf?src-supplier=Element14; ComponentLink3Description: https://datasheet.ciiva.com/28695/1678796-28695758.pdf?src-supplier=Element14; ComponentLink4URL: https://datasheet.ciiva.com/16778/70260739-16778335.pdf?src-supplier=Allied+Electronics; ComponentLink4Description: https://datasheet.ciiva.com/16778/70260739-16778335.pdf?src-supplier=Allied+Electronics; ComponentLink5URL: https://datasheet.ciiva.com/48531/aoa0000ce1-48531077.pdf?src-supplier=Avnet; ComponentLink5Description: https://datasheet.ciiva.com/48531/aoa0000ce1-48531077.pdf?src-supplier=Avnet; ComponentLink6URL: https://datasheet.ciiva.com/30097/4aoa0000ce1-30097116.pdf?src-supplier=Onlinecomponents.com; ComponentLink6Description: https://datasheet.ciiva.com/30097/4aoa0000ce1-30097116.pdf?src-supplier=Onlinecomponents.com; ComponentLink7URL: https://datasheet.ciiva.com/43460/1678796-43460347.pdf?src-supplier=Farnell; ComponentLink7Description: https://datasheet.ciiva.com/43460/1678796-43460347.pdf?src-supplier=Farnell; ComponentLink8URL: https://datasheet.ciiva.com/5959/1678796-5959692.pdf?src-supplier=Farnell; ComponentLink8Description: https://datasheet.ciiva.com/5959/1678796-5959692.pdf?src-supplier=Farnell; ComponentLink9URL: https://datasheet.ciiva.com/16783/70260739-16783734.pdf?src-supplier=Allied+Electronics; ComponentLink9Description: https://datasheet.ciiva.com/16783/70260739-16783734.pdf?src-supplier=Allied+Electronics
TP28 TP29 TP54-TP58 = TEST POINT: Test Point ON; Item Type: TEST POINT
U18 U19 = DMP2022LSS-13: MOSFET P-CH 20V 10A 8SOP; Manufacturer: Diodes; Supplier: Avnet; Supplier Part Number: DMP2022LSS-13; Manufacturer Part Number: DMP2022LSS-13; RoHS: Yes; Category: MOSFETs; Stock: 37500; Pricing: 2500=0.18459, 5000=0.17798, 10000=0.17262, 15000=0.16758, 20000=0.16128, 25000=0.15876, 250000=0.15624 (USD); ComponentLink1URL: https://datasheet.ciiva.com/946/ds31373-946629.pdf?src-supplier=Digi-Key; ComponentLink1Description: https://datasheet.ciiva.com/946/ds31373-946629.pdf?src-supplier=Digi-Key; ComponentLink2URL: https://datasheet.ciiva.com/946/ds31373-946629.pdf?src-supplier=Avnet; ComponentLink2Description: https://datasheet.ciiva.com/946/ds31373-946629.pdf?src-supplier=Avnet; ComponentLink3URL: https://datasheet.ciiva.com/13045/ds31373-89644-13045812.pdf?src-supplier=Mouser; ComponentLink3Description: https://datasheet.ciiva.com/13045/ds31373-89644-13045812.pdf?src-supplier=Mouser; ComponentLink4URL: https://datasheet.ciiva.com/946/ds31373-946630.pdf?src-supplier=Digi-Key; ComponentLink4Description: https://datasheet.ciiva.com/946/ds31373-946630.pdf?src-supplier=Digi-Key; ComponentLink5URL: https://datasheet.ciiva.com/946/ds31373-946631.pdf?src-supplier=Digi-Key; ComponentLink5Description: https://datasheet.ciiva.com/946/ds31373-946631.pdf?src-supplier=Digi-Key; ComponentLink6URL: https://datasheet.ciiva.com/11174/ds31373-11174902.pdf?src-supplier=Avnet; ComponentLink6Description: https://datasheet.ciiva.com/11174/ds31373-11174902.pdf?src-supplier=Avnet
U20 = SI1024X-T1-GE3: MOSFET 2N-CH 20V 0.485A SC89-6; Manufacturer: Vishay Siliconix; Supplier: Mouser; Supplier Part Number: 781-SI1024X-T1-GE3; Manufacturer Part Number: SI1024X-T1-GE3; RoHS: Yes; Category: MOSFETs; Stock: 297800; Pricing: 1=0.52, 10=0.442, 50=0.442, 100=0.333, 1000=0.206, 10000=0.163 (USD); ComponentLink1URL: https://datasheet.ciiva.com/1253/71170-1253313.pdf?src-supplier=Newark; ComponentLink1Description: https://datasheet.ciiva.com/1253/71170-1253313.pdf?src-supplier=Newark; ComponentLink2URL: https://datasheet.ciiva.com/6388/71170-6388105.pdf?src-supplier=Digi-Key; ComponentLink2Description: https://datasheet.ciiva.com/6388/71170-6388105.pdf?src-supplier=Digi-Key; ComponentLink3URL: https://datasheet.ciiva.com/6388/71170-6388154.pdf?src-supplier=Digi-Key; ComponentLink3Description: https://datasheet.ciiva.com/6388/71170-6388154.pdf?src-supplier=Digi-Key; ComponentLink4URL: https://datasheet.ciiva.com/6388/71170-6388155.pdf?src-supplier=Digi-Key; ComponentLink4Description: https://datasheet.ciiva.com/6388/71170-6388155.pdf?src-supplier=Digi-Key; ComponentLink5URL: https://datasheet.ciiva.com/11161/71170-11161434.pdf?src-supplier=Avnet; ComponentLink5Description: https://datasheet.ciiva.com/11161/71170-11161434.pdf?src-supplier=Avnet

## Sheet INPUT_SUPPLY_PROTECTION.SchDoc
size A4; SheetNumber: 16; SheetTotal: 20
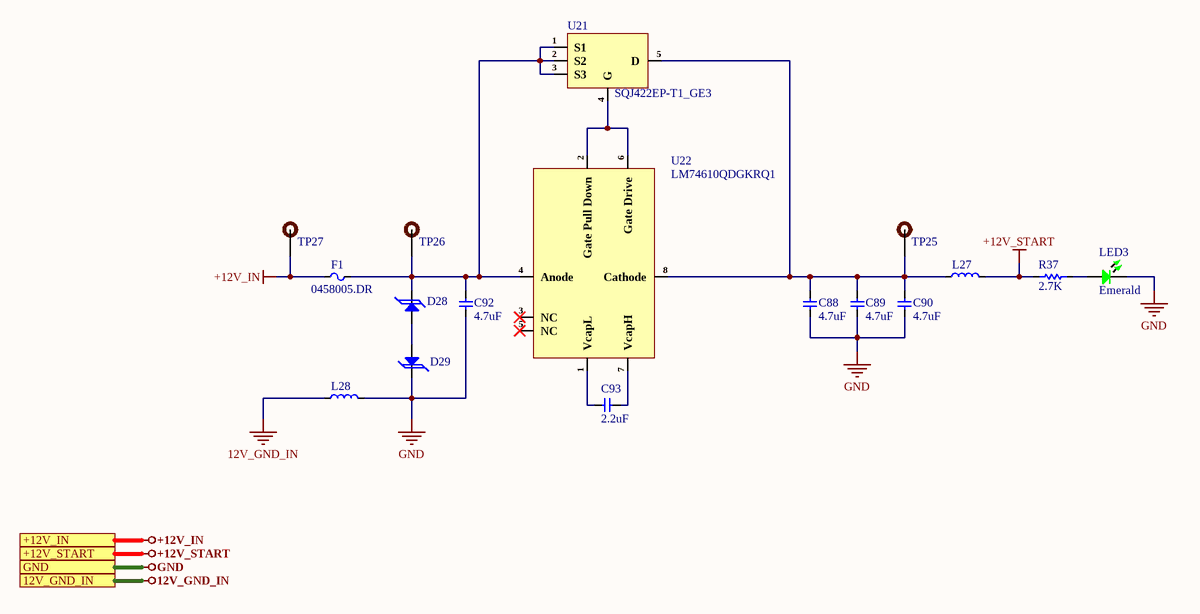
[diagram p15: INPUT_SUPPLY_PROTECTION.SchDoc]

### Parts
C88  4.7uF  [Cap-1206]
C89  4.7uF  [Cap-1206]
C90  4.7uF  [Cap-1206]
C92  4.7uF  [Cap-1206]
C93  2.2uF  [Cap-1206]
D28  SMBJ28A-13-F  [SMB_]  (value not drawn)
D29  SMBJ28A-13-F  [SMB_]  (value not drawn)
F1  0458005.DR  [0458005.DR]
L27  BLM41PG600SH1L  [IND 1806]  (value not drawn)
L28  BLM15AX601SN1D  [IND-0402]  (value not drawn)
LED3  Emerald  [LED-0603]
R37  2.7K  [Res-0603]
TP25  DNP  [Test-point]  (value not drawn)
TP26  DNP  [Test-point]  (value not drawn)
TP27  DNP  [Test-point]  (value not drawn)
U21  SQJ422EP-T1_GE3  [PowerPAK® SO-8]
U22  LM74610QDGKRQ1  [VSSOP-8 (3x3)]

### Ports
12V_GND_IN (see Top_Sheet[2D], CONNECTORS[1D]), +12V_IN (see Top_Sheet[3D], CONNECTORS[1D]), +12V_START (see Top_Sheet[3D], CONNECTORS[1D], DC_DC_CONVERTER[1D], DIGITAL_I-O_O-P[1D]), GND (see Top_Sheet[2D], 03-CAN2_SPI_CAN_CONTROLLER[1D], APALIS_POWER_SUPPLY[1D], CAN2_SPI_CAN_CONTROLLER[1D], CODEC_INTERFACE[1D], CONNECTORS[1D], DC_DC_CONVERTER[1D], DIGITAL_I-O_O-P[1D], ETHERNET_INTERFACE[1D], FUTURE_USE_CONNECTOR[1D], GPIO_NC_INTERFACE[4B], HDMI_INTERFACE[1D], I2C_INTERFACE[1B], LTE_MODULE[1D], MECHANICAL_FOR_PCB[1D], MICRO_SD_CARD_INTERFACE[1D], Reset_and_SDIO[1D], UART_INTERFACE[1D], USB3.0_INTERFACE[1D])

### Nets
12V_GND_IN: L28.1 ; port 12V_GND_IN
+12V_IN: F1.1 TP27.1 ; port +12V_IN
+12V_START: L27.2 R37.1 ; port +12V_START
GND: C88.1 C89.1 C90.1 C92.1 D29.2(K) L28.2 LED3.2 ; port GND
NetC88_2: C88.2 C89.2 C90.2 L27.1 TP25.1 U21.5(D) U22.8(Cathode)
NetC92_2: C92.2 D28.2(K) F1.2 TP26.1 U21.1(S1) U21.2(S2) U21.3(S3) U22.4(Anode)
NetC93_1: C93.1 U22.1(VcapL)
NetC93_2: C93.2 U22.7(VcapH)
NetD28_1: D28.1(A) D29.1(A)
NetLED3_1: LED3.1 R37.2
NetU21_4: U21.4(G) U22.2(Gate_Pull_Down) U22.6(Gate_Drive)

Not connected (* = marked no-connect by the designer): U22 3(NC)* 5(NC)*

### Library data of the parts
C88-C90 C92 = C1206C475M5RACAUTO: CAP CER 4.7UF 50V X7R 1206; Manufacturer: KEMET; Supplier: Mouser; Supplier Part Number: 80-C1206C475M5RAUTO; Manufacturer Part Number: C1206C475M5RACAUTO; RoHS: Yes; Category: Ceramic Capacitors; Stock: 75276; Pricing: 1=0.63, 10=0.443, 50=0.443, 100=0.292, 1000=0.204, 10000=0.149 (USD)
C93 = C1206C225K5RACAUTO7210: CAP CER 2.2UF 50V X7R 1206; Manufacturer: KEMET; Supplier: Mouser; Supplier Part Number: 80-C1206C225K5RAUTLR; Manufacturer Part Number: C1206C225K5RACAUTO7210; RoHS: Yes; Category: Ceramic Capacitors; Stock: 62340; Pricing: 1=0.34, 10=0.231, 50=0.231, 100=0.131, 1000=0.081, 10000=0.063 (USD); ComponentLink1URL: https://api.kemet.com/component-edge/download/datasheet/C1206C225K5RACAUTO7210.pdf?src-supplier=Digi-Key; ComponentLink1Description: https://api.kemet.com/component-edge/download/datasheet/C1206C225K5RACAUTO7210.pdf?src-supplier=Digi-Key; ComponentLink2URL: https://datasheet.octopart.com/C1206C225K5RACAUTO7210-KEMET-datasheet-149525492.pdf?src-supplier=Farnell; ComponentLink2Description: https://datasheet.octopart.com/C1206C225K5RACAUTO7210-KEMET-datasheet-149525492.pdf?src-supplier=Farnell
D28 D29 = SMBJ28A-13-F: TVS DIODE 28VWM 45.4VC SMB; Manufacturer: Diodes; Supplier: Future Electronics; Supplier Part Number: 4657243; Manufacturer Part Number: SMBJ28A-13-F; RoHS: Yes; Category: TVS Diodes; Stock: 111; Pricing: 1=0.37, 15=0.295, 75=0.25, 300=0.215, 1500=0.169 (USD); ComponentLink1URL: https://datasheet.ciiva.com/26912/getdatasheetpartid-234000-26912533.pdf?src-supplier=Verical; ComponentLink1Description: https://datasheet.ciiva.com/26912/getdatasheetpartid-234000-26912533.pdf?src-supplier=Verical; ComponentLink2URL: https://datasheet.ciiva.com/16387/ds19002-16387564.pdf?src-supplier=Future+Electronics; ComponentLink2Description: https://datasheet.ciiva.com/16387/ds19002-16387564.pdf?src-supplier=Future+Electronics
F1 = 0458005.DR: Fuse Chip Fast Acting 5A 75V SMD Solder Pad 1206 Ceramic T/R Automotive cULus; Manufacturer: Littelfuse; Supplier: Rs; Supplier Part Number: 1740294; Manufacturer Part Number: 0458005.DR; RoHS: Yes; Category: Fuses; Stock: 1005; Pricing: 1=0.62077, 10=0.73892, 25=0.71895, 50=0.70003 (GBP); ComponentLink1URL: https://datasheet.ciiva.com/1730/337915-1730547.pdf?src-supplier=Newark; ComponentLink1Description: https://datasheet.ciiva.com/1730/337915-1730547.pdf?src-supplier=Newark; ComponentLink2URL: https://datasheet.ciiva.com/7991/337915-7991910.pdf?src-supplier=Element14; ComponentLink2Description: https://datasheet.ciiva.com/7991/337915-7991910.pdf?src-supplier=Element14; ComponentLink3URL: https://datasheet.ciiva.com/299/littelfuse-fuse-458-series-299786.pdf?src-supplier=Digi-Key; ComponentLink3Description: https://datasheet.ciiva.com/299/littelfuse-fuse-458-series-299786.pdf?src-supplier=Digi-Key; ComponentLink4URL: https://datasheet.ciiva.com/299/littelfuse-fuse-458-series-299787.pdf?src-supplier=Digi-Key; ComponentLink4Description: https://datasheet.ciiva.com/299/littelfuse-fuse-458-series-299787.pdf?src-supplier=Digi-Key; ComponentLink5URL: https://datasheet.ciiva.com/299/littelfuse-fuse-458-series-299788.pdf?src-supplier=Digi-Key; ComponentLink5Description: https://datasheet.ciiva.com/299/littelfuse-fuse-458-series-299788.pdf?src-supplier=Digi-Key
L27 = BLM41PG600SH1L: FERRITE BEAD 60 OHM 1806 1LN; Manufacturer: Murata; Impedance: 60R; Tolerance: 25%; Max Current Rating: 6A; Number of Lines: 1; Test Frequency: 100MHz; Shielding: Unshielded; Supplier: Rs; Supplier Part Number: 1048549; Manufacturer Part Number: BLM41PG600SH1L; RoHS: Yes; Category: Ferrite Beads and Chips; Stock: 2410; Pricing: 10=0.2, 50=0.169, 100=0.15, 500=0.13, 2000=0.12 (GBP); Mounting Technology: Surface Mount; Case/Package: 1806; Case Code (Metric): 4516; Case Code (Imperial): 1806; Contact Plating: Tin,Matte; Min Operating Temperature: -55°C; Max Operating Temperature: 125°C; Package Quantity: 1; Packaging: Tape and Reel; Max DC Current: 6A; Termination: SMD/SMT; Series: EMIFIL®, BLM41P; Length: 4.5mm; Width: 0.063inch; Height: 0.071inch; Ratings: AEC-Q200; Reach SVHC Compliant: No; Lead Free: Lead Free; RoHS Compliant: Yes; ComponentLink1URL: https://datasheet.ciiva.com/29364/l0132s0193blm41p-29364181.pdf?src-supplier=Digi-Key; ComponentLink1Description: https://datasheet.ciiva.com/29364/l0132s0193blm41p-29364181.pdf?src-supplier=Digi-Key; ComponentLink2URL: https://datasheet.ciiva.com/3067/c31e-3067201.pdf?src-supplier=Avnet; ComponentLink2Description: https://datasheet.ciiva.com/3067/c31e-3067201.pdf?src-supplier=Avnet
L28 = BLM15AX601SN1D: FERRITE BEAD 600 OHM 0402 1LN; Manufacturer: Murata; Material: Steel,Ferrite; Tolerance: 25%; Impedance: 600R; Current Rating: 500mA; Number of Lines: 1; DC Resistance (DCR): 340mR; Test Frequency: 100MHz; Supplier: Rs; Supplier Part Number: 8390786P; Manufacturer Part Number: BLM15AX601SN1D; RoHS: Yes; Category: Ferrite Beads and Chips; Stock: 31900; Pricing: 1000=0.019, 2000=0.016, 5000=0.014, 10000=0.013 (GBP); Case/Package: 0402; Pins: 2; Case Code (Metric): 1005; Case Code (Imperial): 0402; Core Material: Ferrite; Min Operating Temperature: -55°C; Max Operating Temperature: 125°C; Package Quantity: 1; Packaging: Tape and Reel; Max Current Rating: 500mA; Termination: SMD/SMT; Max DC Current: 500mA; Number of Circuits: 1; Series: BLM15AX_SN; DC Resistance-Max: 340mR; RMS Current (Irms): 500mA; ESR: 340mR; Length: 1mm; Width: 0.5mm; Height: 0.5mm; Depth: 0.5mm; Reach SVHC Compliant: No; Lead Free: Lead Free; RoHS Compliant: Yes; ComponentLink1URL: https://datasheet.ciiva.com/1012/l0110s0100blm15ax-sn-1012320.pdf?src-supplier=Digi-Key; ComponentLink1Description: https://datasheet.ciiva.com/1012/l0110s0100blm15ax-sn-1012320.pdf?src-supplier=Digi-Key; ComponentLink2URL: https://datasheet.ciiva.com/41425/001171675-da-01-en-chip-drossel0402-600r-420ma-1-0x0-5mm-41425713.pdf?src-supplier=Conrad; ComponentLink2Description: https://datasheet.ciiva.com/41425/001171675-da-01-en-chip-drossel0402-600r-420ma-1-0x0-5mm-41425713.pdf?src-supplier=Conrad; ComponentLink3URL: https://datasheet.ciiva.com/41449/001172169-da-01-en-drossel-0402-600r-1-0x0-5mm-10000st-41449458.pdf?src-supplier=Conrad; ComponentLink3Description: https://datasheet.ciiva.com/41449/001172169-da-01-en-drossel-0402-600r-1-0x0-5mm-10000st-41449458.pdf?src-supplier=Conrad; ComponentLink4URL: https://datasheet.ciiva.com/1012/l0110e-1012321.pdf?src-supplier=Digi-Key; ComponentLink4Description: https://datasheet.ciiva.com/1012/l0110e-1012321.pdf?src-supplier=Digi-Key; ComponentLink5URL: https://datasheet.ciiva.com/1012/l0110e-1012322.pdf?src-supplier=Digi-Key; ComponentLink5Description: https://datasheet.ciiva.com/1012/l0110e-1012322.pdf?src-supplier=Digi-Key; ComponentLink6URL: https://datasheet.ciiva.com/16420/l0110s0100blm15ax-sn-16420781.pdf?src-supplier=Future+Electronics; ComponentLink6Description: https://datasheet.ciiva.com/16420/l0110s0100blm15ax-sn-16420781.pdf?src-supplier=Future+Electronics
LED3 = NCD0603G2: Emerald 0603 Light Emitting Diodes (LED) ROHS; Manufacturer: Foshan NationStar Optoelectronics; Manufacturer Part Number: NCD0603G2; Package: 0603; LCSC Part Number: C87326; Item Type: LED; ComponentLink1Description: LCSC; ComponentLink1URL: https://www.lcsc.com/product-detail/Light-Emitting-Diodes-LED_Foshan-NationStar-Optoelectronics-NCD0603G2_C87326.html
R37 = ERA-3AEB272V: RES SMD 2.7K OHM 0.1% 1/10W 0603; Manufacturer: Panasonic; Supplier: Mouser; Supplier Part Number: 667-ERA-3AEB272V; Manufacturer Part Number: ERA-3AEB272V; RoHS: Yes; Category: Chip SMD Resistors; Stock: 13910; Pricing: 1=0.34, 10=0.224, 50=0.224, 100=0.09, 1000=0.05, 10000=0.036 (USD); ComponentLink1URL: https://datasheet.ciiva.com/11808/0900766b80fe20f7-11808049.pdf?src-supplier=Rs; ComponentLink1Description: https://datasheet.ciiva.com/11808/0900766b80fe20f7-11808049.pdf?src-supplier=Rs; ComponentLink2URL: https://datasheet.ciiva.com/29183/450927-da-01-en-widerstand-0603-era-29183778.pdf?src-supplier=Conrad; ComponentLink2Description: https://datasheet.ciiva.com/29183/450927-da-01-en-widerstand-0603-era-29183778.pdf?src-supplier=Conrad; ComponentLink3URL: https://datasheet.ciiva.com/9196/aoa0000ce26-9196935.pdf?src-supplier=Avnet; ComponentLink3Description: https://datasheet.ciiva.com/9196/aoa0000ce26-9196935.pdf?src-supplier=Avnet; ComponentLink4URL: https://datasheet.ciiva.com/43457/485442-43457768.pdf?src-supplier=Farnell; ComponentLink4Description: https://datasheet.ciiva.com/43457/485442-43457768.pdf?src-supplier=Farnell; ComponentLink5URL: https://datasheet.ciiva.com/43455/485442-43455224.pdf?src-supplier=Farnell; ComponentLink5Description: https://datasheet.ciiva.com/43455/485442-43455224.pdf?src-supplier=Farnell; ComponentLink6URL: https://datasheet.ciiva.com/48530/era-eng-tds-48530485.pdf?src-supplier=Distrelec; ComponentLink6Description: https://datasheet.ciiva.com/48530/era-eng-tds-48530485.pdf?src-supplier=Distrelec; ComponentLink7URL: https://datasheet.ciiva.com/48425/era-eng-tds-48425448.pdf?src-supplier=Distrelec; ComponentLink7Description: https://datasheet.ciiva.com/48425/era-eng-tds-48425448.pdf?src-supplier=Distrelec; ComponentLink8URL: https://datasheet.ciiva.com/46422/485442-46422632.pdf?src-supplier=Element14; ComponentLink8Description: https://datasheet.ciiva.com/46422/485442-46422632.pdf?src-supplier=Element14; ComponentLink9URL: https://datasheet.ciiva.com/46422/485442-46422633.pdf?src-supplier=Element14; ComponentLink9Description: https://datasheet.ciiva.com/46422/485442-46422633.pdf?src-supplier=Element14; ComponentLink10URL: https://datasheet.ciiva.com/46422/485442-46422634.pdf?src-supplier=Element14; ComponentLink10Description: https://datasheet.ciiva.com/46422/485442-46422634.pdf?src-supplier=Element14; ComponentLink11URL: https://datasheet.ciiva.com/6000/485442-6000521.pdf?src-supplier=Farnell; ComponentLink11Description: https://datasheet.ciiva.com/6000/485442-6000521.pdf?src-supplier=Farnell; ComponentLink12URL: https://datasheet.ciiva.com/6000/485442-6000524.pdf?src-supplier=Farnell; ComponentLink12Description: https://datasheet.ciiva.com/6000/485442-6000524.pdf?src-supplier=Farnell
TP25-TP27 = TEST POINT: Test Point ON; Item Type: TEST POINT
U21 = SQJ422EP-T1_GE3: MOSFET N-CH 40V 74A PPAK SO-8; Manufacturer: Vishay; Supplier: Mouser; Supplier Part Number: 781-SQJ422EP-T1_GE3; Manufacturer Part Number: SQJ422EP-T1_GE3; RoHS: Yes; Category: MOSFETs; Stock: 26296; Pricing: 1=1.62, 10=1.43, 50=1.43, 100=1.18, 1000=0.798, 10000=0.714 (USD); ComponentLink1URL: https://datasheet.ciiva.com/28599/1760635-28599505.pdf?src-supplier=Element14; ComponentLink1Description: https://datasheet.ciiva.com/28599/1760635-28599505.pdf?src-supplier=Element14; ComponentLink2URL: https://datasheet.ciiva.com/29745/sqj422ep-29745736.pdf?src-supplier=Digi-Key; ComponentLink2Description: https://datasheet.ciiva.com/29745/sqj422ep-29745736.pdf?src-supplier=Digi-Key
U22 = LM74610QDGKRQ1: IC SMART DIODE CTLR 8VSSOP; Manufacturer: Texas Instruments; Supplier: Mouser; Supplier Part Number: 595-LM74610QDGKRQ1; Manufacturer Part Number: LM74610QDGKRQ1; RoHS: Yes; Category: Power Management ICs; Stock: 5066; Pricing: 1=2.47, 10=2.1, 50=2.1, 100=1.83, 1000=1.31, 10000=1.14 (USD); ComponentLink1URL: http://www.ti.com/lit/ds/symlink/lm74610-q1.pdf?src-supplier=Digi-Key; ComponentLink1Description: http://www.ti.com/lit/ds/symlink/lm74610-q1.pdf?src-supplier=Digi-Key